# Altium schematic sheet ADC.SchDoc
size A3; SheetNumber: 2; SheetTotal: 8
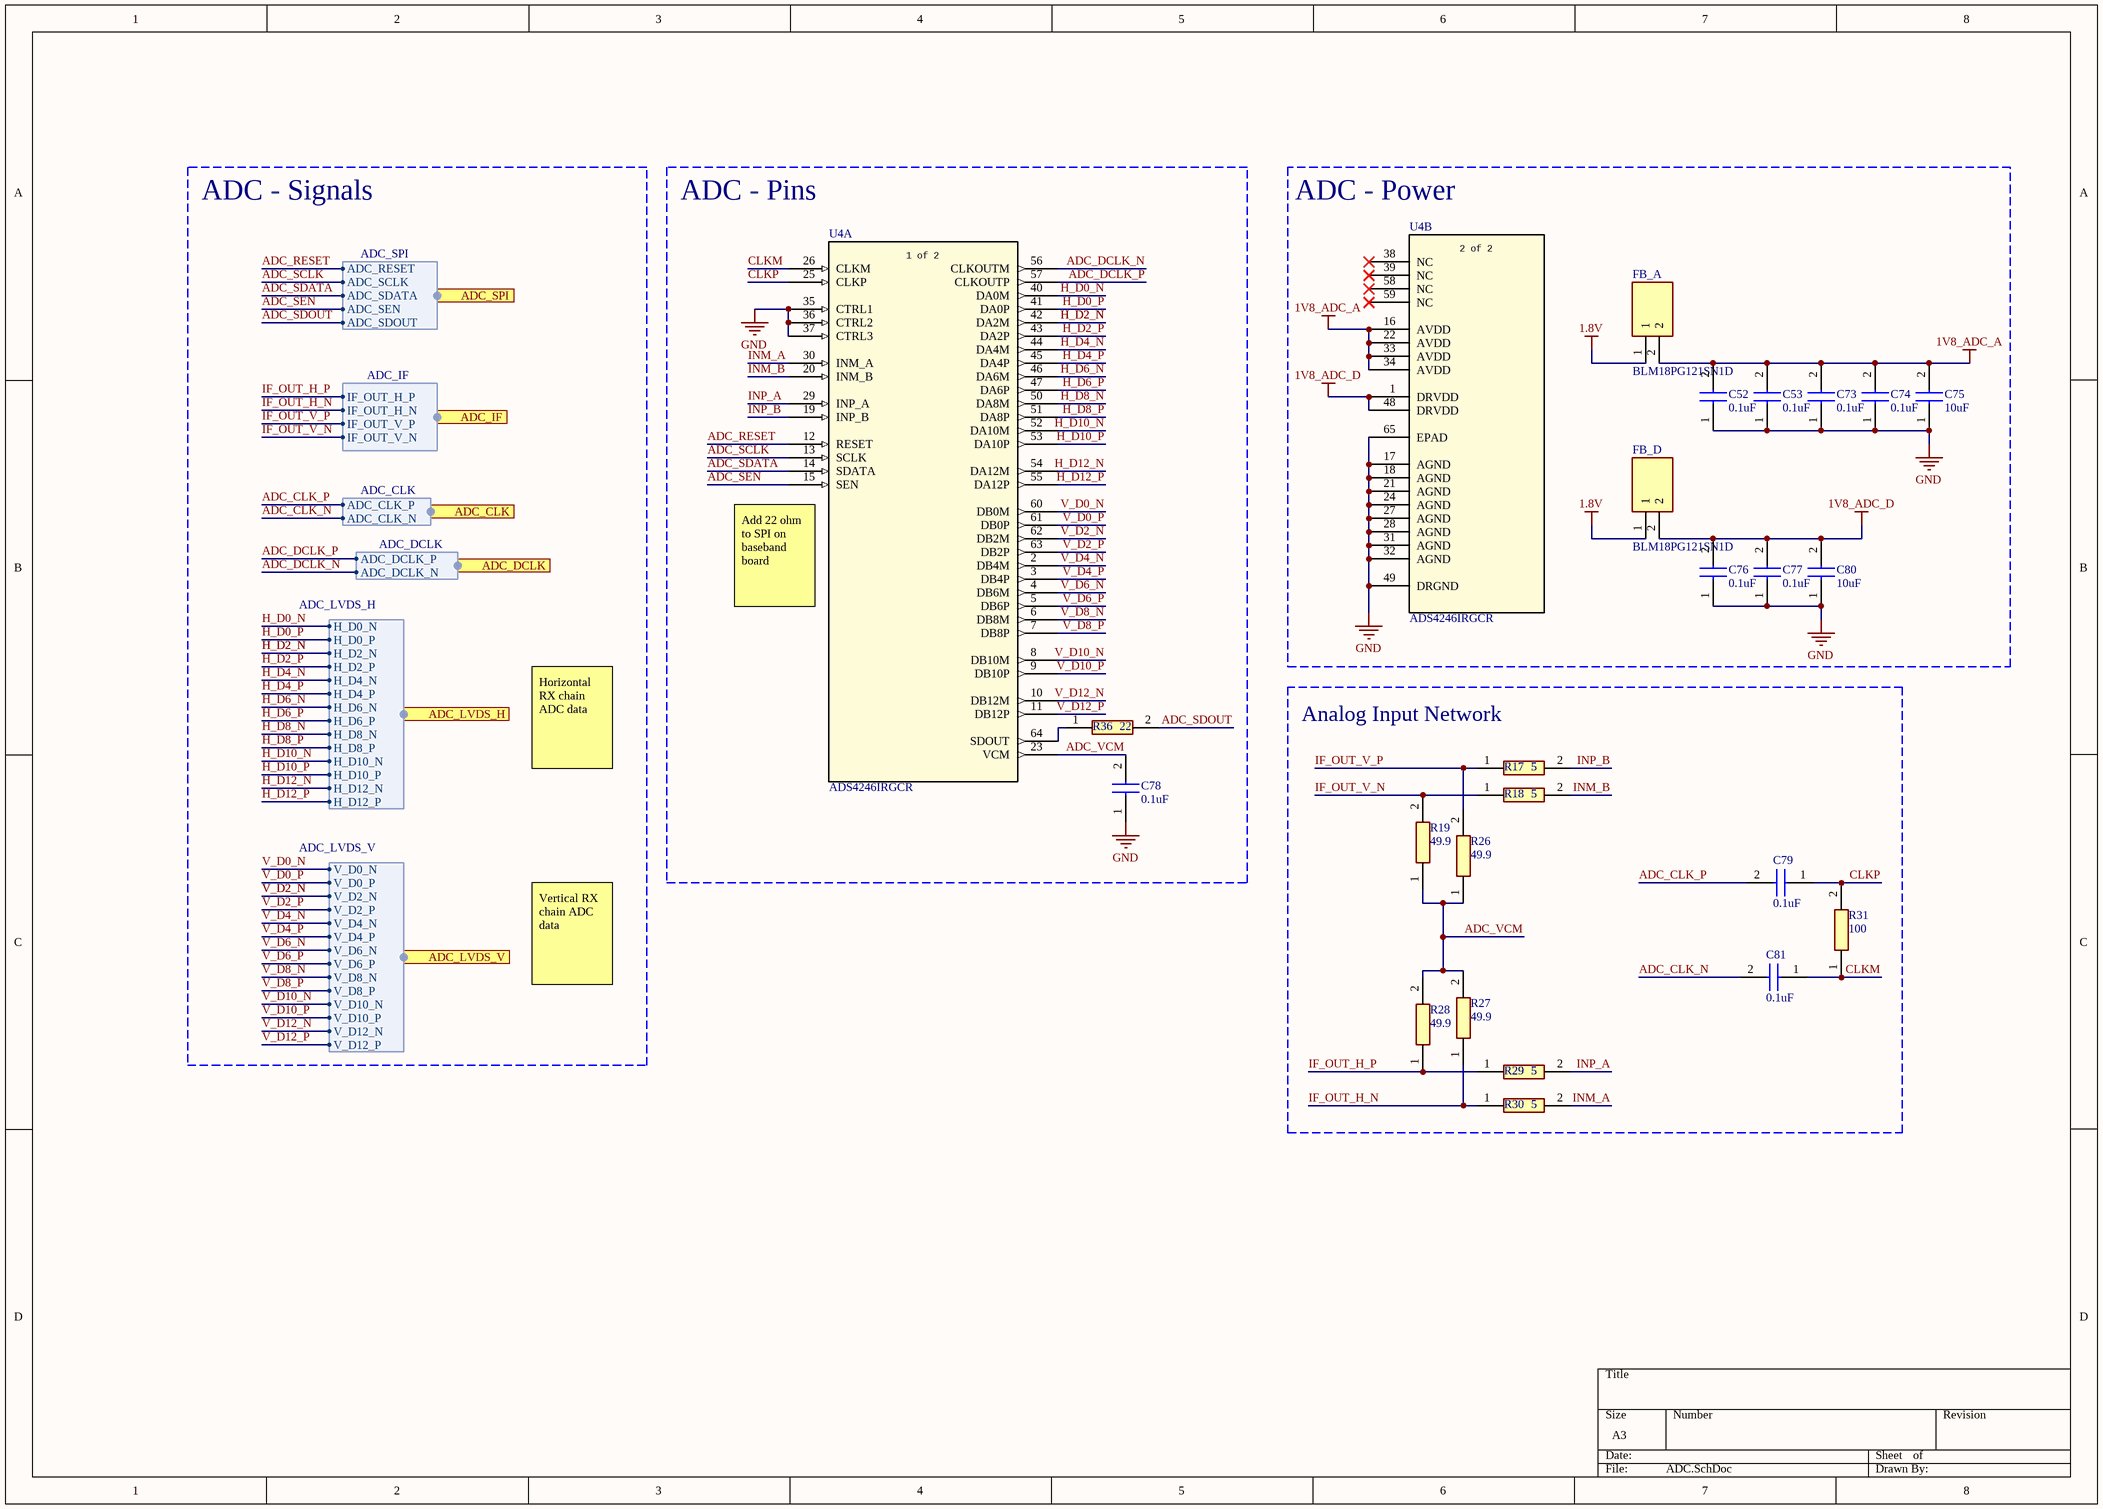
[diagram p0: ADC.SchDoc]

## Parts
C52  0.1uF  [C0402C104J4RACTU]
C53  0.1uF  [C0402C104J4RACTU]
C73  0.1uF  [C0402C104J4RACTU]
C74  0.1uF  [C0402C104J4RACTU]
C75  10uF  [C1206_FT]
C76  0.1uF  [C0402C104J4RACTU]
C77  0.1uF  [C0402C104J4RACTU]
C78  0.1uF  [C0402C104J4RACTU]
C79  0.1uF  [C0402C104J4RACTU]
C80  10uF  [C1206_FT]
C81  0.1uF  [C0402C104J4RACTU]
FB_A  BLM18PG121SN1D  [BLM18SP221SN1B]
FB_D  BLM18PG121SN1D  [BLM18SP221SN1B]
R17  5  [RESC1005X40N]
R18  5  [RESC1005X40N]
R19  49.9  [RESC1005X40N]
R26  49.9  [RESC1005X40N]
R27  49.9  [RESC1005X40N]
R28  49.9  [RESC1005X40N]
R29  5  [RESC1005X40N]
R30  5  [RESC1005X40N]
R31  100  [RESC1005X37N]
R36  22  [RESC1005X40N]
U4  ADS4246IRGCR  [RGC64_7P4X7P4]  (parts A,B of 2)

## Blocks framed on the sheet
ADC - Pins: C78 R36 U4
ADC - Power: C52 C53 C73-C77 C80 FB_A FB_D U4
Analog Input Network: C79 C81 R17-R19 R26-R31

## Ports
ADC_CLK (harness ADC_CLK), ADC_DCLK (harness ADC_DCLK), ADC_IF (harness ADC_IF), ADC_LVDS_H (harness ADC_LVDS_H), ADC_LVDS_V (harness ADC_LVDS_V), ADC_SPI (harness ADC_SPI)

## Harnesses
ADC_IF: IF_OUT_V_N, IF_OUT_H_N, IF_OUT_H_P, IF_OUT_V_P
ADC_CLK: ADC_CLK_P, ADC_CLK_N
ADC_SPI: ADC_SCLK, ADC_SEN, ADC_SDOUT, ADC_SDATA, ADC_RESET
ADC_LVDS_H: H_D0_N, H_D12_P, H_D12_N, H_D10_P, H_D10_N, H_D8_P, H_D8_N, H_D6_P, H_D6_N, H_D4_N, H_D2_P, H_D2_N, H_D0_P, H_D4_P
ADC_LVDS_V: V_D0_N, V_D12_P, V_D12_N, V_D10_P, V_D10_N, V_D8_P, V_D8_N, V_D6_P, V_D6_N, V_D4_N, V_D2_P, V_D0_P, V_D4_P, V_D2_N
ADC_DCLK: ADC_DCLK_N, ADC_DCLK_P

## Nets
1.8V: FB_A.1 FB_D.1
1V8_ADC_A: C52.2 C53.2 C73.2 C74.2 C75.2 FB_A.2 U4.16(AVDD) U4.22(AVDD) U4.33(AVDD) U4.34(AVDD)
1V8_ADC_D: C76.2 C77.2 C80.2 FB_D.2 U4.1(DRVDD) U4.48(DRVDD)
GND: C52.1 C53.1 C73.1 C74.1 C75.1 C76.1 C77.1 C78.1 C80.1 U4.17(AGND) U4.18(AGND) U4.21(AGND) U4.24(AGND) U4.27(AGND) U4.28(AGND) U4.31(AGND) U4.32(AGND) U4.35(CTRL1) U4.36(CTRL2) U4.37(CTRL3) U4.49(DRGND) U4.65(EPAD)
ADC_CLK_N: C81.2 ; port ADC_CLK.ADC_CLK_N
ADC_CLK_P: C79.2 ; port ADC_CLK.ADC_CLK_P
ADC_DCLK_N: U4.56(CLKOUTM) ; port ADC_DCLK.ADC_DCLK_N
ADC_DCLK_P: U4.57(CLKOUTP) ; port ADC_DCLK.ADC_DCLK_P
ADC_RESET: U4.12(RESET) ; port ADC_SPI.ADC_RESET
ADC_SCLK: U4.13(SCLK) ; port ADC_SPI.ADC_SCLK
ADC_SDATA: U4.14(SDATA) ; port ADC_SPI.ADC_SDATA
ADC_SDOUT: R36.2 ; port ADC_SPI.ADC_SDOUT
ADC_SEN: U4.15(SEN) ; port ADC_SPI.ADC_SEN
ADC_VCM: C78.2 R19.1 R26.1 R27.2 R28.2 U4.23(VCM)
CLKM: C81.1 R31.1 U4.26(CLKM)
CLKP: C79.1 R31.2 U4.25(CLKP)
H_D0_N: U4.40(DA0M) ; port ADC_LVDS_H.H_D0_N
H_D0_P: U4.41(DA0P) ; port ADC_LVDS_H.H_D0_P
H_D2_N: U4.42(DA2M) ; port ADC_LVDS_H.H_D2_N
H_D2_P: U4.43(DA2P) ; port ADC_LVDS_H.H_D2_P
H_D4_N: U4.44(DA4M) ; port ADC_LVDS_H.H_D4_N
H_D4_P: U4.45(DA4P) ; port ADC_LVDS_H.H_D4_P
H_D6_N: U4.46(DA6M) ; port ADC_LVDS_H.H_D6_N
H_D6_P: U4.47(DA6P) ; port ADC_LVDS_H.H_D6_P
H_D8_N: U4.50(DA8M) ; port ADC_LVDS_H.H_D8_N
H_D8_P: U4.51(DA8P) ; port ADC_LVDS_H.H_D8_P
H_D10_N: U4.52(DA10M) ; port ADC_LVDS_H.H_D10_N
H_D10_P: U4.53(DA10P) ; port ADC_LVDS_H.H_D10_P
H_D12_N: U4.54(DA12M) ; port ADC_LVDS_H.H_D12_N
H_D12_P: U4.55(DA12P) ; port ADC_LVDS_H.H_D12_P
IF_OUT_H_N: R27.1 R30.1 ; port ADC_IF.IF_OUT_H_N
IF_OUT_H_P: R28.1 R29.1 ; port ADC_IF.IF_OUT_H_P
IF_OUT_V_N: R18.1 R19.2 ; port ADC_IF.IF_OUT_V_N
IF_OUT_V_P: R17.1 R26.2 ; port ADC_IF.IF_OUT_V_P
INM_A: R30.2 U4.30(INM_A)
INM_B: R18.2 U4.20(INM_B)
INP_A: R29.2 U4.29(INP_A)
INP_B: R17.2 U4.19(INP_B)
V_D0_N: U4.60(DB0M) ; port ADC_LVDS_V.V_D0_N
V_D0_P: U4.61(DB0P) ; port ADC_LVDS_V.V_D0_P
V_D2_N: U4.62(DB2M) ; port ADC_LVDS_V.V_D2_N
V_D2_P: U4.63(DB2P) ; port ADC_LVDS_V.V_D2_P
V_D4_N: U4.2(DB4M) ; port ADC_LVDS_V.V_D4_N
V_D4_P: U4.3(DB4P) ; port ADC_LVDS_V.V_D4_P
V_D6_N: U4.4(DB6M) ; port ADC_LVDS_V.V_D6_N
V_D6_P: U4.5(DB6P) ; port ADC_LVDS_V.V_D6_P
V_D8_N: U4.6(DB8M) ; port ADC_LVDS_V.V_D8_N
V_D8_P: U4.7(DB8P) ; port ADC_LVDS_V.V_D8_P
V_D10_N: U4.8(DB10M) ; port ADC_LVDS_V.V_D10_N
V_D10_P: U4.9(DB10P) ; port ADC_LVDS_V.V_D10_P
V_D12_N: U4.10(DB12M) ; port ADC_LVDS_V.V_D12_N
V_D12_P: U4.11(DB12P) ; port ADC_LVDS_V.V_D12_P
NetR36_1: R36.1 U4.64(SDOUT)

Not connected (* = marked no-connect by the designer): U4 38(NC)* 39(NC)* 58(NC)* 59(NC)*

## Notes on the sheet
- ADC - Signals
- (near U4) Add 22 ohm to SPI on baseband board
- Horizontal RX chain ADC data
- Vertical RX chain ADC data
- (in symbol ADS4246IRGCR, part A) 1 of 2
- (in symbol ADS4246IRGCR, part B) 2 of 2

## Library data of the parts
C52 C53 C73 C74 C76-C79 C81 = 0402 0.1uF Capacitor: C0402C104K4RACTU; Manufacturer_Name: Yageo Group; Datasheet Link: https://content.kemet.com/datasheets/KEM_C1002_X7R_SMD.pdf; Height: 0.55mm; Manufacturer_Part_Number: C0402C104K4RACTU; Mouser Part Number: 80-C0402C104K4R; Mouser Price/Stock: https://www.mouser.co.uk/ProductDetail/KEMET/C0402C104K4RACTU?qs=DBJr%252BvBUjU54jK7d4uAeew%3D%3D; Arrow Part Number: C0402C104K4RACTU; Arrow Price/Stock: https://www.arrow.com/en/products/c0402c104k4ractu/kemet-corporation.html?utm_currency=USD&region=nac
C75 C80 = 1206 10uF Capacitor: C1206X106M3RACAUTO; Manufacturer_Name: Yageo Group; Datasheet Link: https://www.yageogroup.com/content/datasheet/asset/file/KEM_C1078_X7R_FT-CAP_AUTO_SMD; Manufacturer_Part_Number: C1206X106M3RACAUTO; Mouser Part Number: 80-C1206X106M3RAUTO; Mouser Price/Stock: https://www.mouser.co.uk/ProductDetail/KEMET/C1206X106M3RACAUTO?qs=HXFqYaX1Q2xSroSoadzbnw%3D%3D; Arrow Part Number: C1206X106M3RACAUTO; Arrow Price/Stock: https://www.arrow.com/en/products/c1206x106m3racauto/kemet-corporation?utm_currency=USD&region=nac
FB_A FB_D = BLM18PG121SN1D: Ferrite Bead; Manufacturer_Name: Murata Electronics; Datasheet Link: http://www.murata.com/~/media/webrenewal/support/library/catalog/products/emc/emifil/c31e.ashx?la=en-gb; Height: 0.95mm; Manufacturer_Part_Number: BLM18PG121SN1D; Mouser Part Number: 81-BLM18PG121SN1D; Mouser Price/Stock: https://www.mouser.co.uk/ProductDetail/Murata-Electronics/BLM18PG121SN1D?qs=tY8e8KZalarVxhnmnUYZ1A%3D%3D; Arrow Part Number: BLM18PG121SN1D; Arrow Price/Stock: https://www.arrow.com/en/products/blm18pg121sn1d/murata-manufacturing.html?utm_currency=USD&region=europe
R17 R18 R29 R30 = 0402 5 Ohm Resistor: RC0402FR-075R1L; Manufacturer_Name: Yageo Group; Datasheet Link: https://yageogroup.com/component-documentation/download/specsheet/RC0402FR-075R1L?lang=en; Height: 0.4mm; Manufacturer_Part_Number: RC0402FR-075R1L; Mouser Part Number: 603-RC0402FR-075R1L; Mouser Price/Stock: https://www.mouser.co.uk/ProductDetail/YAGEO/RC0402FR-075R1L?qs=beCmh%2FXShNcKHNb5Mim9zw%3D%3D; Arrow Part Number: RC0402FR-075R1L; Arrow Price/Stock: https://www.arrow.com/en/products/rc0402fr-075r1l/yageo?region=nac
R19 R26-R28 = 0402 49.9 Ohm Resistor: RC0402FR-0749R9L; Manufacturer_Name: Yageo Group; Datasheet Link: https://www.yageo.com/upload/media/product/productsearch/datasheet/rchip/PYu-RC_Group_51_RoHS_L_12.pdf; Height: 0.4mm; Manufacturer_Part_Number: RC0402FR-0749R9L; Mouser Part Number: 603-RC0402FR-0749R9L; Mouser Price/Stock: https://www.mouser.co.uk/ProductDetail/YAGEO/RC0402FR-0749R9L?qs=lywS2nZzkrJ8zCaO%252B%252Bic5Q%3D%3D; Arrow Part Number: RC0402FR-0749R9L; Arrow Price/Stock: https://www.arrow.com/en/products/rc0402fr-0749r9l/yageo?region=nac
R31 = 0402 100 Ohm Resistor: AC0402FR-07100RL; Manufacturer_Name: Yageo Group; Datasheet Link: https://www.arrow.com/en/products/ac0402fr-07100rl/yageo?region=nac; Height: 0.37mm; Manufacturer_Part_Number: AC0402FR-07100RL; Mouser Part Number: 603-AC0402FR-07100RL; Mouser Price/Stock: https://www.mouser.co.uk/ProductDetail/YAGEO/AC0402FR-07100RL?qs=yhV1fb9g%2FKaIIQxJBW5mdg%3D%3D; Arrow Part Number: AC0402FR-07100RL; Arrow Price/Stock: https://www.arrow.com/en/products/ac0402fr-07100rl/yageo?region=nac
R36 = 0402 22 Ohm Resistor: RC0402FR-0722RL; Manufacturer_Name: Yageo Group; Datasheet Link: https://yageogroup.com/products/Resistors/part/RC0402FR-0722RL; Height: 0.4mm; Manufacturer_Part_Number: RC0402FR-0722RL; Mouser Part Number: 603-RC0402FR-0722RL; Mouser Price/Stock: https://www.mouser.co.uk/ProductDetail/YAGEO/RC0402FR-0722RL?qs=V1yeUXFNrkkRg6zf08ADKQ%3D%3D; Arrow Part Number: RC0402FR-0722RL; Arrow Price/Stock: https://www.arrow.com/en/products/rc0402fr-0722rl/yageo
U4 = ADS4246IRGCR: Dual-Channel, 14-Bit, 160-MSPS Analog-to-Digital Converter (ADC) 64-VQFN -40 to 85; Manufacturer_Name: Texas Instruments; Copyright: Copyright (C) 2026 Ultra Librarian. All rights reserved.; Manufacturer_Part_Number: ADS4246IRGCR; Datasheet: https://www.ti.com/lit/gpn/ads4246; RefDes: RefDes; Type: Type